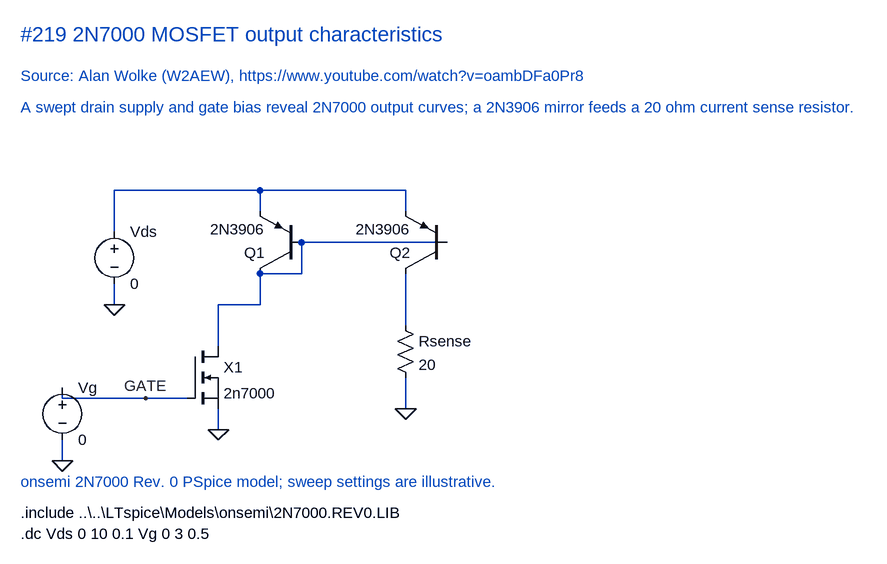
[diagram p0: schematic 2N7000 MOSFET curve tracer.asc]
2N7000 MOSFET curve tracer.asc, the LTspice schematic file:
Version 4.1
SHEET 1 1120 912
WIRE 176 336 176 272
WIRE 400 304 400 272
WIRE 624 304 624 272
WIRE 400 272 176 272
WIRE 624 272 400 272
WIRE 176 416 176 448
WIRE 400 400 400 448
WIRE 464 400 400 400
WIRE 464 400 464 352
WIRE 688 352 464 352
WIRE 624 400 624 480
WIRE 400 448 336 448
WIRE 336 448 336 512
WIRE 624 560 624 608
WIRE 336 608 336 640
WIRE 96 592 288 592
WIRE 96 576 96 592
WIRE 96 656 96 688
FLAG 176 448 0
FLAG 624 608 0
FLAG 336 640 0
FLAG 96 688 0
FLAG 224 592 GATE
SYMBOL voltage 176 320 R0
SYMATTR InstName Vds
SYMATTR Value 0
SYMBOL pnp 464 400 R180
SYMATTR InstName Q1
SYMATTR Value 2N3906
SYMBOL pnp 688 400 R180
SYMATTR InstName Q2
SYMATTR Value 2N3906
SYMBOL res 608 464 R0
SYMATTR InstName Rsense
SYMATTR Value 20
SYMBOL voltage 96 560 R0
SYMATTR InstName Vg
SYMATTR Value 0
SYMBOL nmos 288 512 R0
SYMATTR Prefix X
SYMATTR InstName X1
SYMATTR Value 2n7000
TEXT 32 32 Left 3 ;#219 2N7000 MOSFET output characteristics
TEXT 32 96 Left 2 ;Source: Alan Wolke (W2AEW), https://www.youtube.com/watch?v=oambDFa0Pr8
TEXT 32 144 Left 2 ;A swept drain supply and gate bias reveal 2N7000 output curves; a 2N3906 mirror feeds a 20 ohm current sense resistor.
TEXT 32 720 Left 2 ;onsemi 2N7000 Rev. 0 PSpice model; sweep settings are illustrative.
TEXT 32 768 Left 2 !.include ..\..\LTspice\Models\onsemi\2N7000.REV0.LIB
TEXT 32 800 Left 2 !.dc Vds 0 10 0.1 Vg 0 3 0.5

The netlist it stands for:
* 2N7000 MOSFET curve tracer.asc
Vds N001 0 0
Q1 N002 N002 N001 0 2N3906
Q2 N003 N002 N001 0 2N3906
Rsense N003 0 20
Vg GATE 0 0
X§X1 N002 GATE 0 2n7000  ; pins D G S
.model NPN NPN
.model PNP PNP
.lib standard.bjt
* #219 2N7000 MOSFET output characteristics
* Source: Alan Wolke (W2AEW), https://www.youtube.com/watch?v=oambDFa0Pr8
* A swept drain supply and gate bias reveal 2N7000 output curves; a 2N3906 mirror feeds a 20 ohm current sense resistor.
* onsemi 2N7000 Rev. 0 PSpice model; sweep settings are illustrative.
.include ..\..\LTspice\Models\onsemi\2N7000.REV0.LIB
.dc Vds 0 10 0.1 Vg 0 3 0.5
.backanno
.end